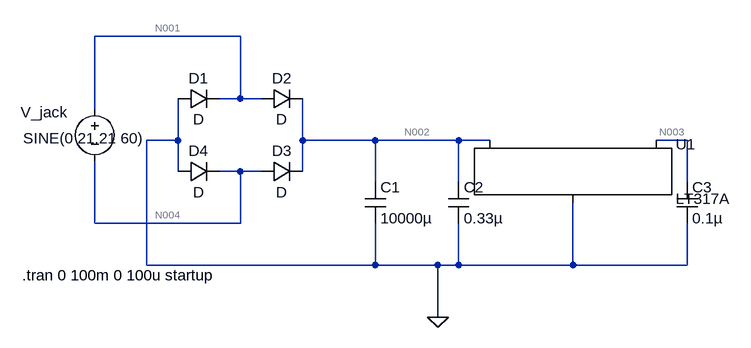
[diagram p0: schematic Power Source Switching Citcuit.asc]
Power Source Switching Citcuit.asc, the LTspice schematic file:
Version 4.1
SHEET 1 992 680
WIRE 240 -48 16 -48
WIRE 240 48 240 -48
WIRE 240 48 208 48
WIRE 272 48 240 48
WIRE 16 64 16 -48
WIRE 144 112 144 48
WIRE 144 112 96 112
WIRE 336 112 336 48
WIRE 448 112 336 112
WIRE 576 112 448 112
WIRE 624 112 576 112
WIRE 928 112 880 112
WIRE 144 160 144 112
WIRE 240 160 208 160
WIRE 272 160 240 160
WIRE 336 160 336 112
WIRE 448 176 448 112
WIRE 576 176 576 112
WIRE 928 176 928 112
WIRE 16 240 16 144
WIRE 240 240 240 160
WIRE 240 240 16 240
WIRE 96 304 96 112
WIRE 448 304 448 240
WIRE 448 304 96 304
WIRE 544 304 448 304
WIRE 576 304 576 240
WIRE 576 304 544 304
WIRE 752 304 752 208
WIRE 752 304 576 304
WIRE 928 304 928 240
WIRE 928 304 752 304
WIRE 544 384 544 304
FLAG 544 384 0
SYMBOL voltage 16 48 R0
WINDOW 0 -114 21 Left 2
WINDOW 123 -110 61 Left 2
WINDOW 39 0 0 Left 0
SYMATTR InstName V_jack
SYMATTR Value ""
SYMATTR Value2 SINE(0 21.21 60)
SYMBOL diode 144 64 R270
WINDOW 0 32 32 VTop 2
WINDOW 3 0 32 VBottom 2
SYMATTR InstName D1
SYMBOL diode 272 64 R270
WINDOW 0 32 32 VTop 2
WINDOW 3 0 32 VBottom 2
SYMATTR InstName D2
SYMBOL diode 272 176 R270
WINDOW 0 32 32 VTop 2
WINDOW 3 0 32 VBottom 2
SYMATTR InstName D3
SYMBOL diode 144 176 R270
WINDOW 0 32 32 VTop 2
WINDOW 3 0 32 VBottom 2
SYMATTR InstName D4
SYMBOL cap 432 176 R0
SYMATTR InstName C1
SYMATTR Value 10000µ
SYMBOL cap 560 176 R0
SYMATTR InstName C2
SYMATTR Value 0.33µ
SYMBOL cap 912 176 R0
SYMATTR InstName C3
SYMATTR Value 0.1µ
SYMBOL PowerProducts\\LT317A 752 112 R0
SYMATTR InstName U1
TEXT -96 320 Left 2 !.tran 0 100m 0 100u startup

The netlist it stands for:
* Power Source Switching Citcuit.asc
V_jack N001 N004 SINE(0 21.21 60)
D1 0 N001 D
D2 N001 N002 D
D3 N004 N002 D
D4 0 N004 D
C1 N002 0 10000µ
C2 N002 0 0.33µ
C3 N003 0 0.1µ
X§U1 0 N003 N002 LT317A
.model D D
.lib standard.dio
.tran 0 100m 0 100u startup
.lib LTC.lib
.backanno
.end

* Results of the author's LTspice run, read from the files saved beside the schematic
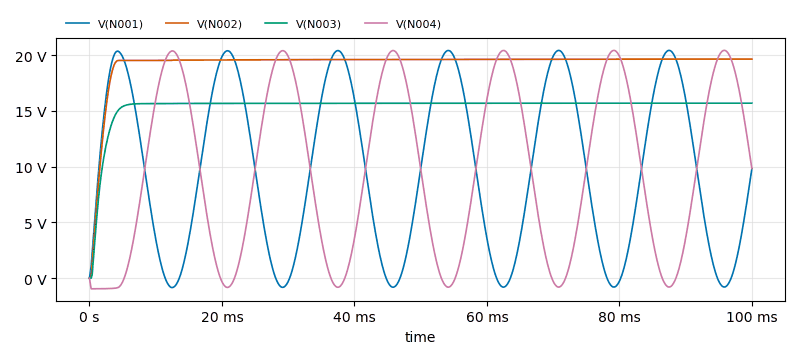
[diagram p1: Transient Analysis of Power Source Switching Citcuit.asc, plotted from the saved traces]
* Transient Analysis, 1 run:
*   V(N001): min -835.9 mV, max 20.42 V, average 9.636 V, rms 12.2 V, last 9.821 V
*   V(N002): min 10.16 mV, max 19.64 V, average 19.27 V, rms 19.38 V, last 19.64 V
*   V(N003): min 120.2 µV, max 15.7 V, average 15.4 V, rms 15.49 V, last 15.7 V
*   V(N004): min -947 mV, max 20.42 V, average 9.636 V, rms 12.31 V, last 9.821 V